# Altium schematic sheet Encoder.SchDoc
size A4; DocumentNumber: 3; SheetNumber: 4; SheetTotal: 8
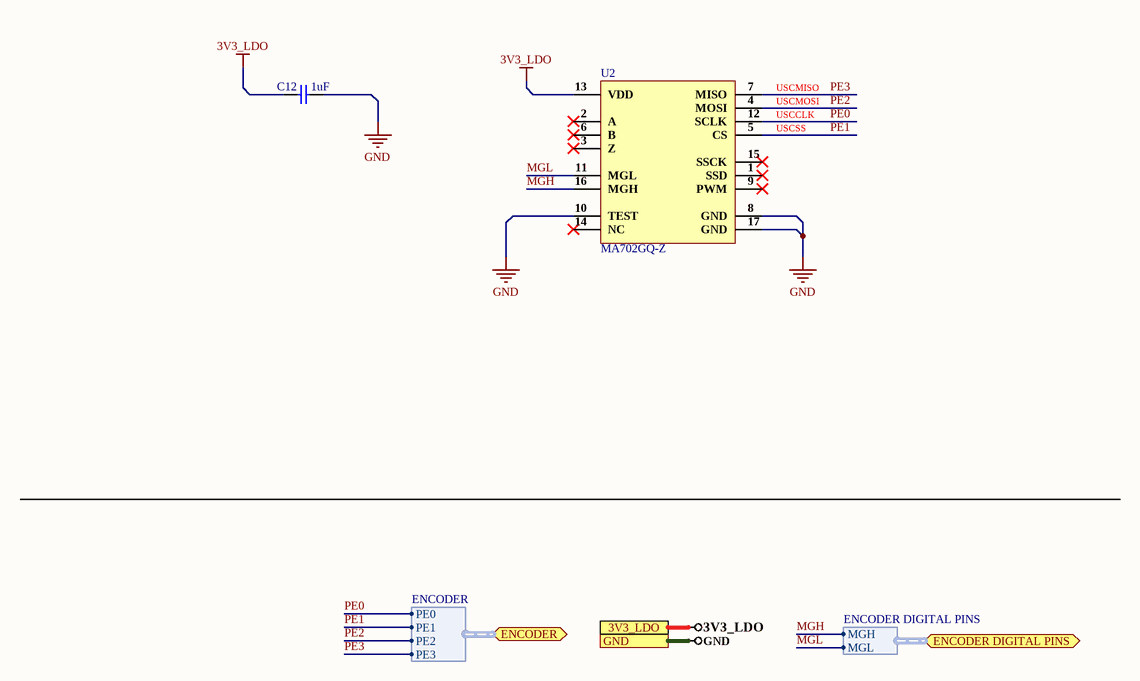
[diagram p0: Encoder.SchDoc]

## Parts
C12  1uF  [Cap-0603]
U2  MA702GQ-Z  [16-QFN (3x3).]

## Ports
3V3_LDO, ENCODER (bidir, harness ENCODER), ENCODER DIGITAL PINS (bidir, harness ENCODER DIGITAL PINS), GND

## Harnesses
ENCODER: PE0, PE1, PE2, PE3
ENCODER DIGITAL PINS: MGH, MGL

## Nets
3V3_LDO: C12.1 U2.13(VDD) ; port 3V3_LDO
GND: C12.2 U2.8(GND) U2.10(TEST) U2.17(GND) ; port GND
MGH: U2.16(MGH) ; port ENCODER DIGITAL PINS.MGH
MGL: U2.11(MGL) ; port ENCODER DIGITAL PINS.MGL
PE0: U2.12(SCLK) ; port ENCODER.PE0
PE1: U2.5(CS) ; port ENCODER.PE1
PE2: U2.4(MOSI) ; port ENCODER.PE2
PE3: U2.7(MISO) ; port ENCODER.PE3

Not connected (* = marked no-connect by the designer): U2 1(SSD)* 2(A)* 3(Z)* 6(B)* 9(PWM)* 14(NC)* 15(SSCK)*

## Notes on the sheet
- (near U2) USCCLK
- (near U2) USCMOSI
- (near U2) USCMISO
- (near U2) USCSS
- File:
- Title:
- Date:
- Page
- Num:
- Total:
- Drawn By: Huzaifa Ali

## Library data of the parts
C12 = UMK107AB7105KA-T: CAP CER 1UF 50V X7R 0603; Manufacturer: Taiyo Yuden; Tolerance: 10%; ComponentLink1URL: http://www.farnell.com/datasheets/2048165.pdf?src-supplier=Element14; ComponentLink1Description: http://www.farnell.com/datasheets/2048165.pdf?src-supplier=Element14; ComponentLink2URL: https://www.murata.com/~/media/webrenewal/support/library/catalog/products/capacitor/mlcc/c02e.ashx?la=en-us&src-supplier=Digi-Key; ComponentLink2Description: https://www.murata.com/~/media/webrenewal/support/library/catalog/products/capacitor/mlcc/c02e.ashx?la=en-us&src-supplier=Digi-Key; Supplier 1: Digi-Key; Manufacturer Part Number: UMK107AB7105KA-T; Stock 1: 453098; Pricing 1: 1=0.28, 10=0.19, 100=0.1079, 500=0.0762, 1000=0.0667 (USD); Mount: Surface Mount; Case/Package: 0603; Case Code (Metric): 1608; Case Code (Imperial): 0603; Min Operating Temperature: -55°C; Max Operating Temperature: 125°C; Packaging: Tape and Reel; Package Quantity: 1; Capacitance: 1uF; Voltage Rating: 50V; Voltage Rating (DC): 50V; Dielectric: X7R; Termination: SMD/SMT; Length: 1.6mm; Height: 0.8mm; Width: 0.031inch; Thickness: 0.037inch; Depth: 0.8mm; Radiation Hardening: No; Halogen Free: Halogen Free; ComponentLink3URL: https://www.yuden.co.jp/productdata/catalog/mlcc_all_e.pdf?src-supplier=Digi-Key; ComponentLink3Description: https://www.yuden.co.jp/productdata/catalog/mlcc_all_e.pdf?src-supplier=Digi-Key; ComponentLink4URL: https://www.yuden.co.jp/productdata/catalog/mlcc_all_e.pdf?src-supplier=Onlinecomponents.com; ComponentLink4Description: https://www.yuden.co.jp/productdata/catalog/mlcc_all_e.pdf?src-supplier=Onlinecomponents.com; Supplier Part Number 1: 587-3247-1-ND; LCSC Part Number: C105174
U2 = MA702GQ-Z: SENSOR ANGLE SMD; Manufacturer: Monolithic Power Systems; Sensing Method: Hall Effect; Frequency: 26MHz; Frequency Stability: 10ppm; Max Supply Current: 7mA; Item Type: IC; Supplier 1: Avnet; Manufacturer Part Number: MA702GQ-Z; RoHS: Yes; Stock 1: 110000; Pricing 1: 5000=3.15000, 10000=2.97500, 20000=2.80000, 30000=2.62500, 40000=2.45000 (USD); Mount: Surface Mount; Case/Package: QFN; Min Operating Temperature: -40°C; Max Operating Temperature: 85°C; Packaging: Tape and Reel; Termination: SMD/SMT; RoHS Compliant: Yes; ComponentLink1URL: https://www.monolithicpower.com/pub/media/document/m/a/ma702_r1.0.pdf?src-supplier=Digi-Key; ComponentLink1Description: https://www.monolithicpower.com/pub/media/document/m/a/ma702_r1.0.pdf?src-supplier=Digi-Key; Supplier Part Number 1: MA702GQ-Z